# EAGLE design rotor_khamex_3.3 (EAGLE 7.6.0)

## Sheet 1 of 3
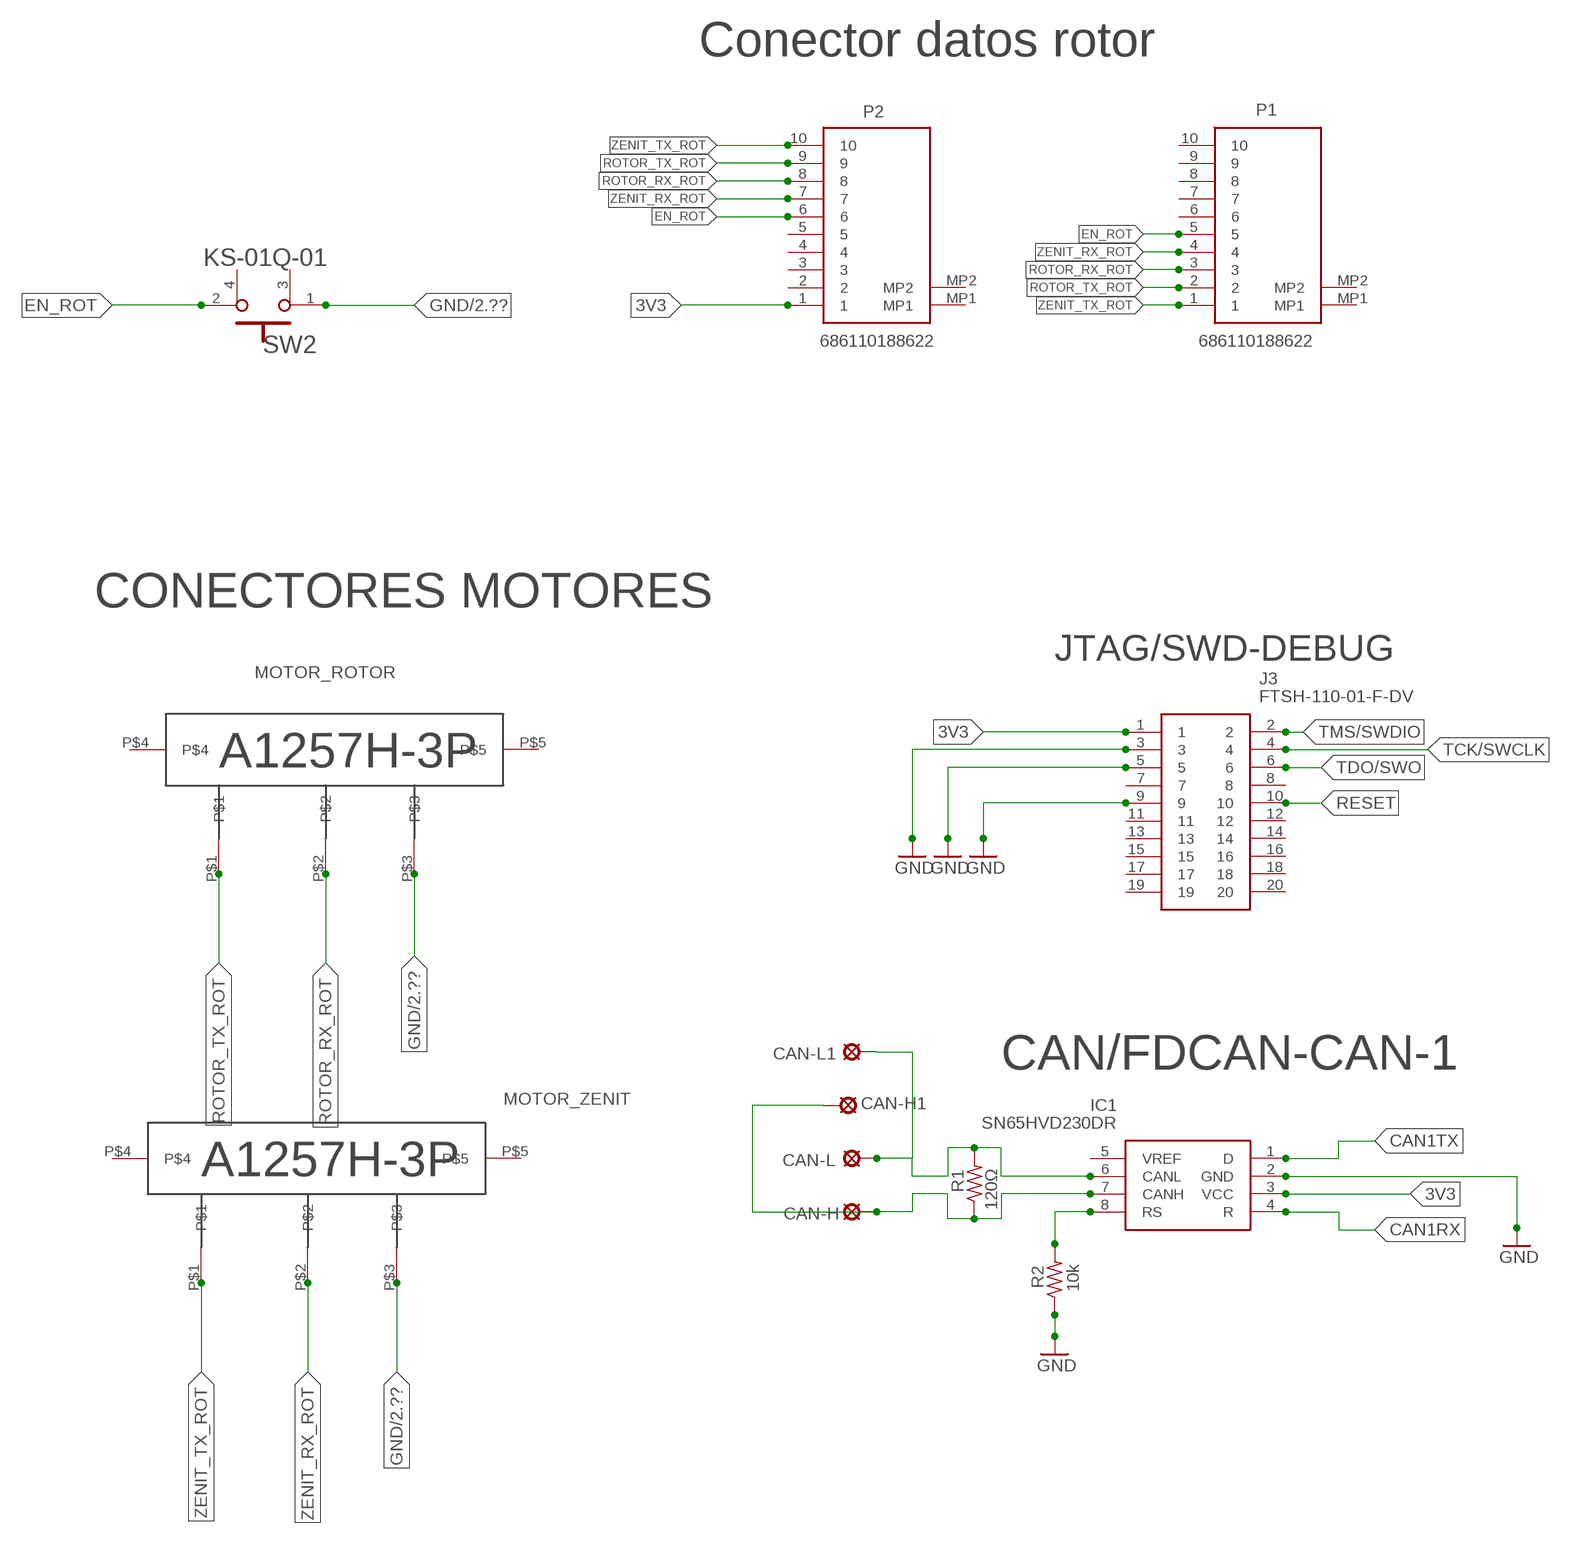
[diagram p0: schematic, sheet 1, part 1 of 2]
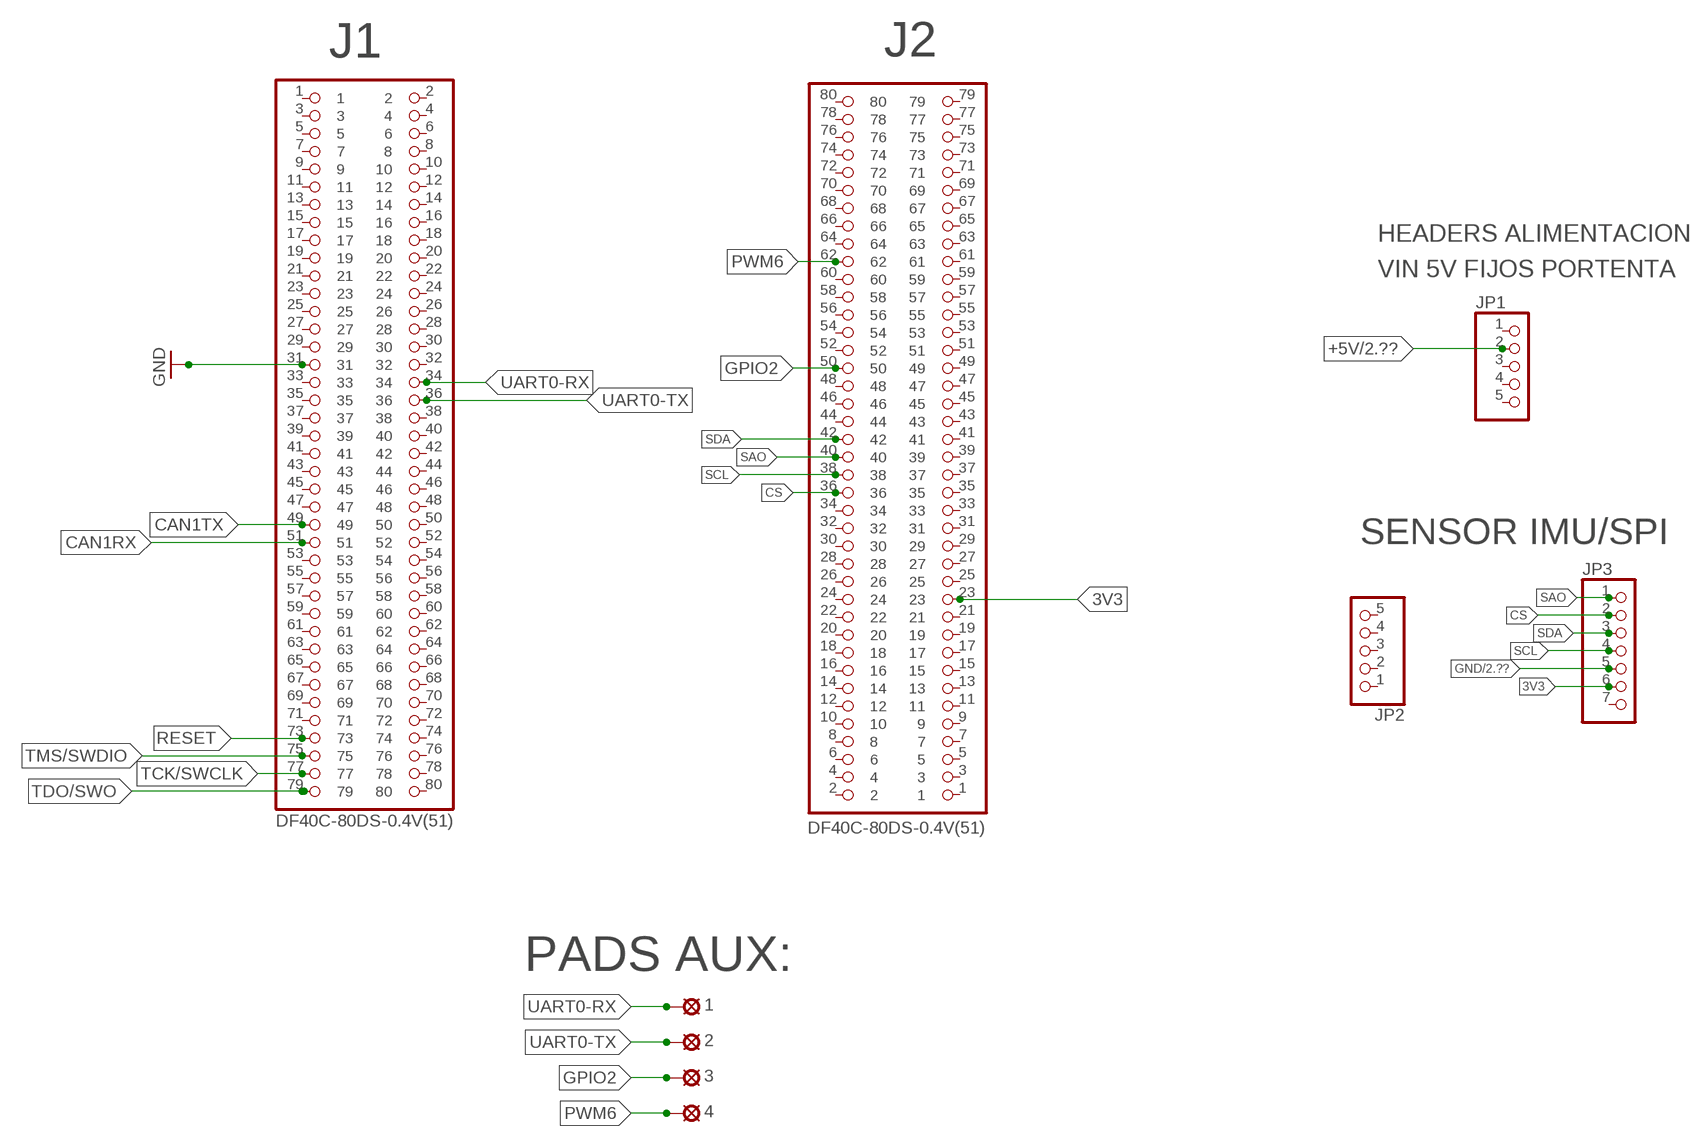
[diagram p1: schematic, sheet 1, part 2 of 2]

### Parts
1  LSP11  [LSP11]
2  LSP11  [LSP11]
3  LSP11  [LSP11]
4  LSP11  [LSP11]
CAN-H  LSP11  [LSP11]
CAN-H1  LSP11  [LSP11]
CAN-L  LSP11  [LSP11]
CAN-L1  LSP11  [LSP11]
IC1  SN65HVD230DR  [SOT127P600X175-8N]
J1  DF40C-80DS-0.4V(51)  [HRS_DF40C-80DS-0.4V(51)]
J2  DF40C-80DS-0.4V(51)  [HRS_DF40C-80DS-0.4V(51)]
J3  FTSH-110-01-F-DV  [FTSH-110-XX-YYY-DV]
JP1  PINHD-1X5  [1X05]
JP2  PINHD-1X5  [1X05]
JP3  PINHD-1X7  [1X07]
MOTOR_ROTOR  A1257H-3P_DEVICE  [A1257H-3P_PACK]
MOTOR_ZENIT  A1257H-3P_DEVICE  [A1257H-3P_PACK]
P1  686110188622  [686110188622]
P2  686110188622  [686110188622]
R1  120Ω  R-US_M0805  [M0805]
R2  10k  R-US_M0805  [M0805]
SW2  E-SWITCH_KS-01Q-01E-SWITCH_KS-01Q-01_0_0  [E-SWITCH_KS-01Q-01_0]

### Nets
3V3: IC1.3(VCC) J2.23 J3.1 JP3.6 P2.1
+5V [power]: JP1.2 ; also sheet 2
CAN1RX: IC1.4(R) J1.51
CAN1TX: IC1.1(D) J1.49
CS: J2.36 JP3.2
EN_ROT: P1.5 P2.6 SW2.2
GND: IC1.2(GND) J1.31 J3.3 J3.5 J3.9 JP3.5 MOTOR_ROTOR.P$3 MOTOR_ZENIT.P$3 R2.1 SW2.1 ; also sheet 2
GPIO2: 3.MP J2.50
N$12: CAN-H1.MP CAN-H.MP IC1.7(CANH) R1.1
N$13: CAN-L1.MP CAN-L.MP IC1.6(CANL) R1.2
N$15: IC1.8(RS) R2.2
PWM6: 4.MP J2.62
RESET: J1.73 J3.10
ROTOR_RX_ROT: MOTOR_ROTOR.P$2 P1.3 P2.8
ROTOR_TX_ROT: MOTOR_ROTOR.P$1 P1.2 P2.9
SAO: J2.40 JP3.1
SCL: J2.38 JP3.4
SDA: J2.42 JP3.3
TCK/SWCLK: J1.77 J3.4
TDO/SWO: J1.79 J3.6
TMS/SWDIO: J1.75 J3.2
UART0-RX: 1.MP J1.34
UART0-TX: 2.MP J1.36
ZENIT_RX_ROT: MOTOR_ZENIT.P$2 P1.4 P2.7
ZENIT_TX_ROT: MOTOR_ZENIT.P$1 P1.1 P2.10
Unconnected: IC1.5(VREF) J1.1 J1.2 J1.3 J1.4 J1.5 J1.6 J1.7 J1.8 J1.9 J1.10 J1.11 J1.12 J1.13 J1.14 J1.15 J1.16 J1.17 J1.18 J1.19 J1.20 J1.21 J1.22 J1.23 J1.24 J1.25 J1.26 J1.27 J1.28 J1.29 J1.30 J1.32 J1.33 J1.35 J1.37 J1.38 J1.39 J1.40 J1.41 J1.42 J1.43 J1.44 J1.45 J1.46 J1.47 J1.48 J1.50 J1.52 J1.53 J1.54 J1.55 J1.56 J1.57 J1.58 J1.59 J1.60 J1.61 J1.62 J1.63 J1.64 J1.65 J1.66 J1.67 J1.68 J1.69 J1.70 J1.71 J1.72 J1.74 J1.76 J1.78 J1.80 J2.1 J2.2 J2.3 J2.4 J2.5 J2.6 J2.7 J2.8 J2.9 J2.10 J2.11 J2.12 J2.13 J2.14 J2.15 J2.16 J2.17 J2.18 J2.19 J2.20 J2.21 J2.22 J2.24 J2.25 J2.26 J2.27 J2.28 J2.29 J2.30 J2.31 J2.32 J2.33 J2.34 J2.35 J2.37 J2.39 J2.41 J2.43 J2.44 J2.45 J2.46 J2.47 J2.48 J2.49 J2.51 J2.52 J2.53 J2.54 J2.55 J2.56 J2.57 J2.58 J2.59 J2.60 J2.61 J2.63 J2.64 J2.65 J2.66 J2.67 J2.68 J2.69 J2.70 J2.71 J2.72 J2.73 J2.74 J2.75 J2.76 J2.77 J2.78 J2.79 J2.80 J3.7 J3.8 J3.11 J3.12 J3.13 J3.14 J3.15 J3.16 J3.17 J3.18 J3.19 J3.20 JP1.1 JP1.3 JP1.4 JP1.5 JP2.1 JP2.2 JP2.3 JP2.4 JP2.5 JP3.7 MOTOR_ROTOR.P$4 MOTOR_ROTOR.P$5 MOTOR_ZENIT.P$4 MOTOR_ZENIT.P$5 P1.6 P1.7 P1.8 P1.9 P1.10 P1.MP1 P1.MP2 P2.2 P2.3 P2.4 P2.5 P2.MP1 P2.MP2 SW2.3 SW2.4

### Notes on the sheet
- Conector datos rotor
- HEADERS ALIMENTACION
- VIN 5V FIJOS PORTENTA
- SENSOR IMU/SPI
- CONECTORES MOTORES
- JTAG/SWD-DEBUG
- MOTOR_ROTOR
- PADS AUX:
- CAN/FDCAN-CAN-1
- MOTOR_ZENIT

## Sheet 2 of 3
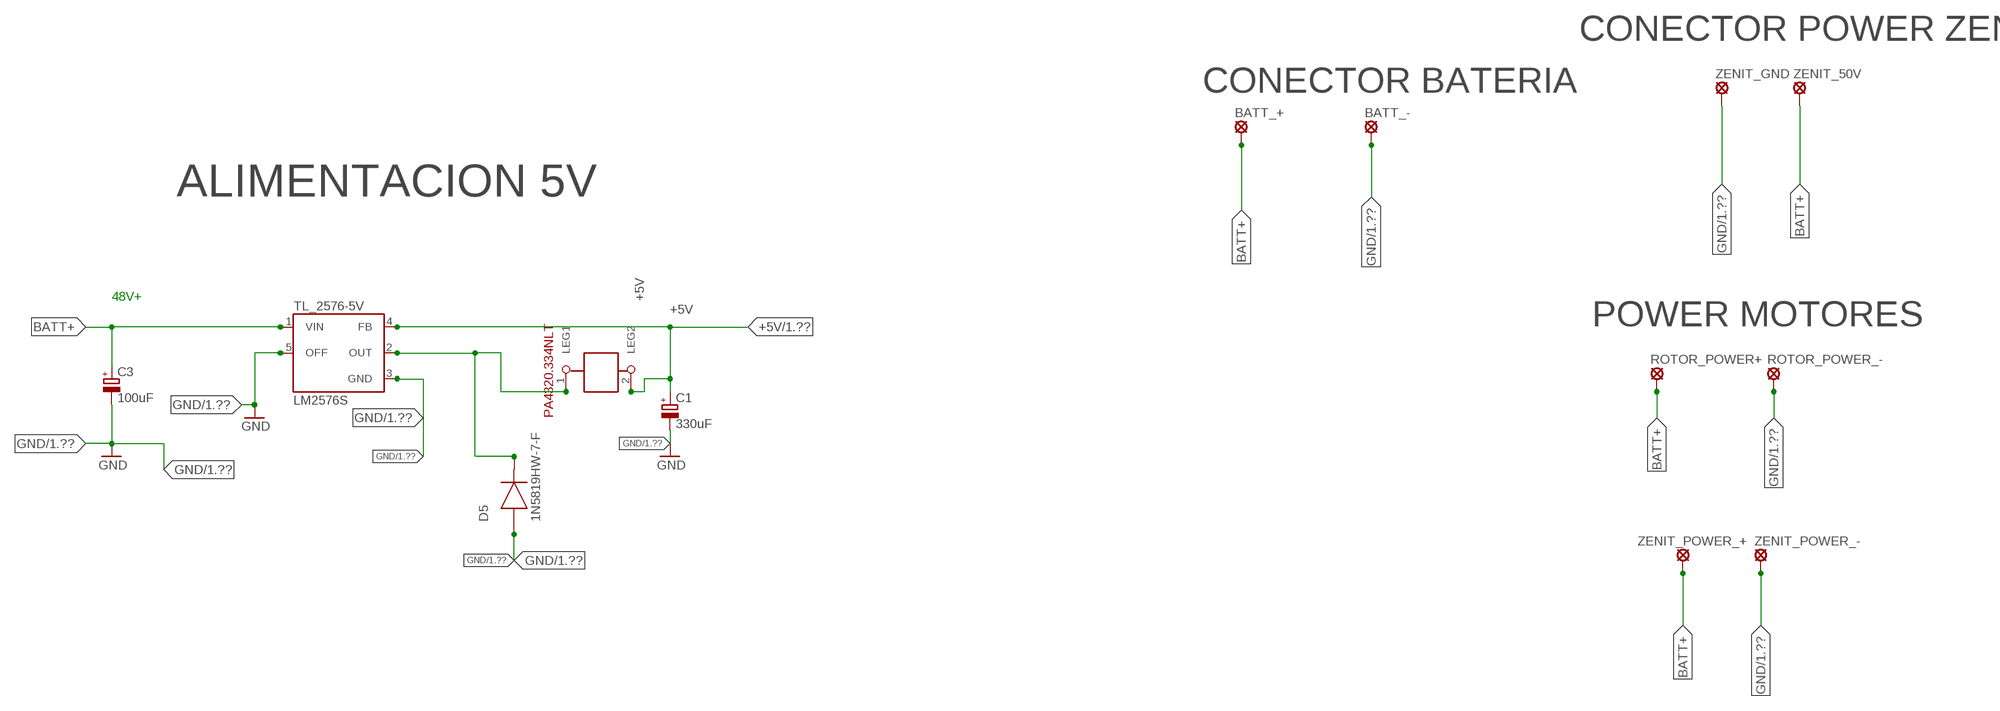
[diagram p2: schematic, sheet 2]

### Parts
BATT_+  SE14  [SE14]
BATT_-  SE14  [SE14]
C1  330uF  CPOL-EUE5-10.5  [E5-10,5]
C3  100uF  CPOL-EUE5-10.5  [E5-10,5]
D5  1N5819HW-7-F  [SOD370155X135]
L  1212  [1212SMDINDUCTORPACK]
ROTOR_POWER+  SE14  [SE14]
ROTOR_POWER_-  SE14  [SE14]
TL_2576-5V  LM2576S  [TO263-5]
ZENIT_50V  SE14  [SE14]
ZENIT_GND  SE14  [SE14]
ZENIT_POWER_+  SE14  [SE14]
ZENIT_POWER_-  SE14  [SE14]

### Nets
+5V [power]: C1.+ L.2(LEG2) TL_2576-5V.4(FB) ; also sheet 1
BATT+ [power]: BATT_+.MP C3.+ ROTOR_POWER+.MP TL_2576-5V.1(VIN) ZENIT_50V.MP ZENIT_POWER_+.MP
GND: BATT_-.MP C1.- C3.- D5.2(A) ROTOR_POWER_-.MP TL_2576-5V.3(GND) TL_2576-5V.5(OFF) ZENIT_GND.MP ZENIT_POWER_-.MP ; also sheet 1
N$2 [power]: D5.1(C) L.1(LEG1) TL_2576-5V.2(OUT)

### Notes on the sheet
- CONECTOR POWER ZENIT
- CONECTOR BATERIA
- ALIMENTACION 5V
- 48V+
- POWER MOTORES

## Sheet 3 of 3

## Library data of the parts
1-4 CAN-H CAN-H1 CAN-L CAN-L1 = solpad:LSP11: SOLDER PAD drill 1.1 mm
BATT_+ BATT_- ROTOR_POWER+ ROTOR_POWER_- ZENIT_50V ZENIT_GND ZENIT_POWER_+ ZENIT_POWER_- = solpad:SE14: SOLDER PAD E1553, drill 1,4mm, distributor Buerklin, 07F820
C1 C3 = rcl:CPOL-EU: POLARIZED CAPACITOR, European symbol
D5 = 1N5819HW-7-F:1N5819HW-7-F: 1N5819HW Series 40 V 1 A Surface Mount Schottky Barrier Rectifier - SOD-123; DESCRIPTION: 1N5819HW Series 40 V 1 A Surface Mount Schottky Barrier Rectifier - SOD-123; DIGI-KEY_PART_NUMBER: 1N5819HW-FDICT-ND; DIGI-KEY_PURCHASE_URL: https://www.digikey.es/product-detail/en/diodes-incorporated/1N5819HW-7-F/1N5819HW-FDICT-ND/815283?utm_source=snapeda&utm_medium=aggregator&utm_campaign=symbol; MF: Diodes Inc.; MP: 1N5819HW-7-F; PACKAGE: SOD-123 Diodes Inc.
IC1 = SN65HVD230DR:SN65HVD230DR: 3.3 V CAN Transceiver with Standby Mode Source: Datasheet <http://www.ti.com/lit/gpn/sn65hvd230>; DESCRIPTION: 3.3 V CAN Transceiver with Standby Mode; HEIGHT: 1.75mm; MANUFACTURER_NAME: Texas Instruments; MANUFACTURER_PART_NUMBER: SN65HVD230DR; MOUSER_PART_NUMBER: 595-SN65HVD230DR; MOUSER_PRICE-STOCK: https://www.mouser.co.uk/ProductDetail/Texas-Instruments/SN65HVD230DR?qs=QViXGNcIEAtifeQR3pYVUQ%3D%3D
J1 J2 = DF40C-80DS-0.4V_51_(1):DF40C-80DS-0.4V(51); CHECK_PRICES: https://www.snapeda.com/parts/DF40C-80DS-0.4V(51)/Hirose/view-part/?ref=eda; DESCRIPTION: Receptáculo del conector de la posición 80, contactos de la tira central Montaje en superficie Oro; DIGIKEY_PART_NUMBER: H11633CT-ND; MF: Hirose; MP: DF40C-80DS-0.4V(51); PACKAGE: None; SNAPEDA_LINK: https://www.snapeda.com/parts/DF40C-80DS-0.4V(51)/Hirose/view-part/?ref=snap
J3 = FTSH-110-01-F-DV:FTSH-110-01-F-DV: 20 Position, High Reliability Header Strips, 0.050" pitch Source: Datasheet <http://suddendocs.samtec.com/prints/ftsh-1xx-xx-xxx-dv-xxx-xxx-mkt.pdf>; DESCRIPTION: 20 Position, High Reliability Header Strips, 0.050&quot; pitch; HEIGHT: mm; MANUFACTURER_NAME: SAMTEC; MANUFACTURER_PART_NUMBER: FTSH-110-01-F-DV; MOUSER_PART_NUMBER: 200-FTSH11001FDV; MOUSER_PRICE-STOCK: https://www.mouser.co.uk/ProductDetail/Samtec/FTSH-110-01-F-DV?qs=92ilVni64gw1JaTDl9rCLg%3D%3D
JP1 JP2 = pinhead:PINHD-1X5: PIN HEADER
JP3 = pinhead:PINHD-1X7: PIN HEADER
L = smd 1212 inductor:1212
MOTOR_ROTOR MOTOR_ZENIT = A1257H-3P:A1257H-3P_DEVICE
P1 P2 = 686110188622:686110188622: FFC & FPC Connectors WR-FPC 1,0mm SMT Horiz. Top Contact Tin Plating{0000} Source: Datasheet <https://www.mouser.ch/datasheet/2/445/686110188622-1843591.pdf>; DESCRIPTION: FFC & FPC Connectors WR-FPC 1,0mm SMT Horiz. Top Contact Tin Plating{0000}; HEIGHT: 3.3mm; MANUFACTURER_NAME: Wurth Elektronik; MANUFACTURER_PART_NUMBER: 686110188622; MOUSER_PART_NUMBER: 710-686110188622; MOUSER_PRICE-STOCK: https://www.mouser.co.uk/ProductDetail/Wurth-Elektronik/686110188622?qs=OlC7AqGiEDnHUpT6yh27Lg%3D%3D
R1 R2 = rcl:R-US_: RESISTOR, American symbol
SW2 = E-Switch - KS-01Q-01:E-SWITCH_KS-01Q-01: Pushbutton Switch SPST-NO Standard Through Hole; ACTUATOR_TYPE: Round, Button; CAPACITANCE: 1.0pF; CURRENT_RATING: 10mA (DC); DATASHEET: https://upverter.com/datasheet/3b708556f29b55c7f5db677c77a74973be95ebea.pdf; DIGIKEY_DESCRIPTION: SWITCH Pushbutton Switch SPST-NO Standard Through Hole; DIGIKEY_PART_NUMBER: EG4791-ND; ELECTRICAL_LIFE: 250,000 Cycles; IMPORTED_FROM: octopart; LEAD_FREE: yes; MECHANICAL_LIFE: 500,000 Cycles; MF: E-Switch; MFG_PACKAGE_IDENT: 29-KS01Q01; MOUSER_PART_NUMBER: 612-KS-01Q-01; MPN: KS-01Q-01; NUM_PINS: 4; OCTOPART_PART_NUMBER: 72a6bab923faad61; PACKAGE: SW_PTH_12MM; PREFIX: SW; ROHS: yes; TEMPERATURE_RANGE_HIGH: +85°C; TEMPERATURE_RANGE_LOW: -20°C; VOLTAGE_RATING_-_DC: 35V; VOLTAGE_RATING_AC: 35 V
TL_2576-5V = v-reg-3:LM2576: National Semiconductor <http://www.national.com> 3.0A "Simple Switcher"(c) 52kHz, Vout 1.23-37V (HV: 57V), Vin 40V (HV: 60V), 50µA standby current

## Net classes
0 default: width 0.381 mm, drill 0.01 mm, clearance 0.254 mm
1 power: width 1.27 mm, drill 0.762 mm, clearance 0.254 mm
2 thin: width 0.254 mm, drill 0.254 mm, clearance 0.254 mm

## Board
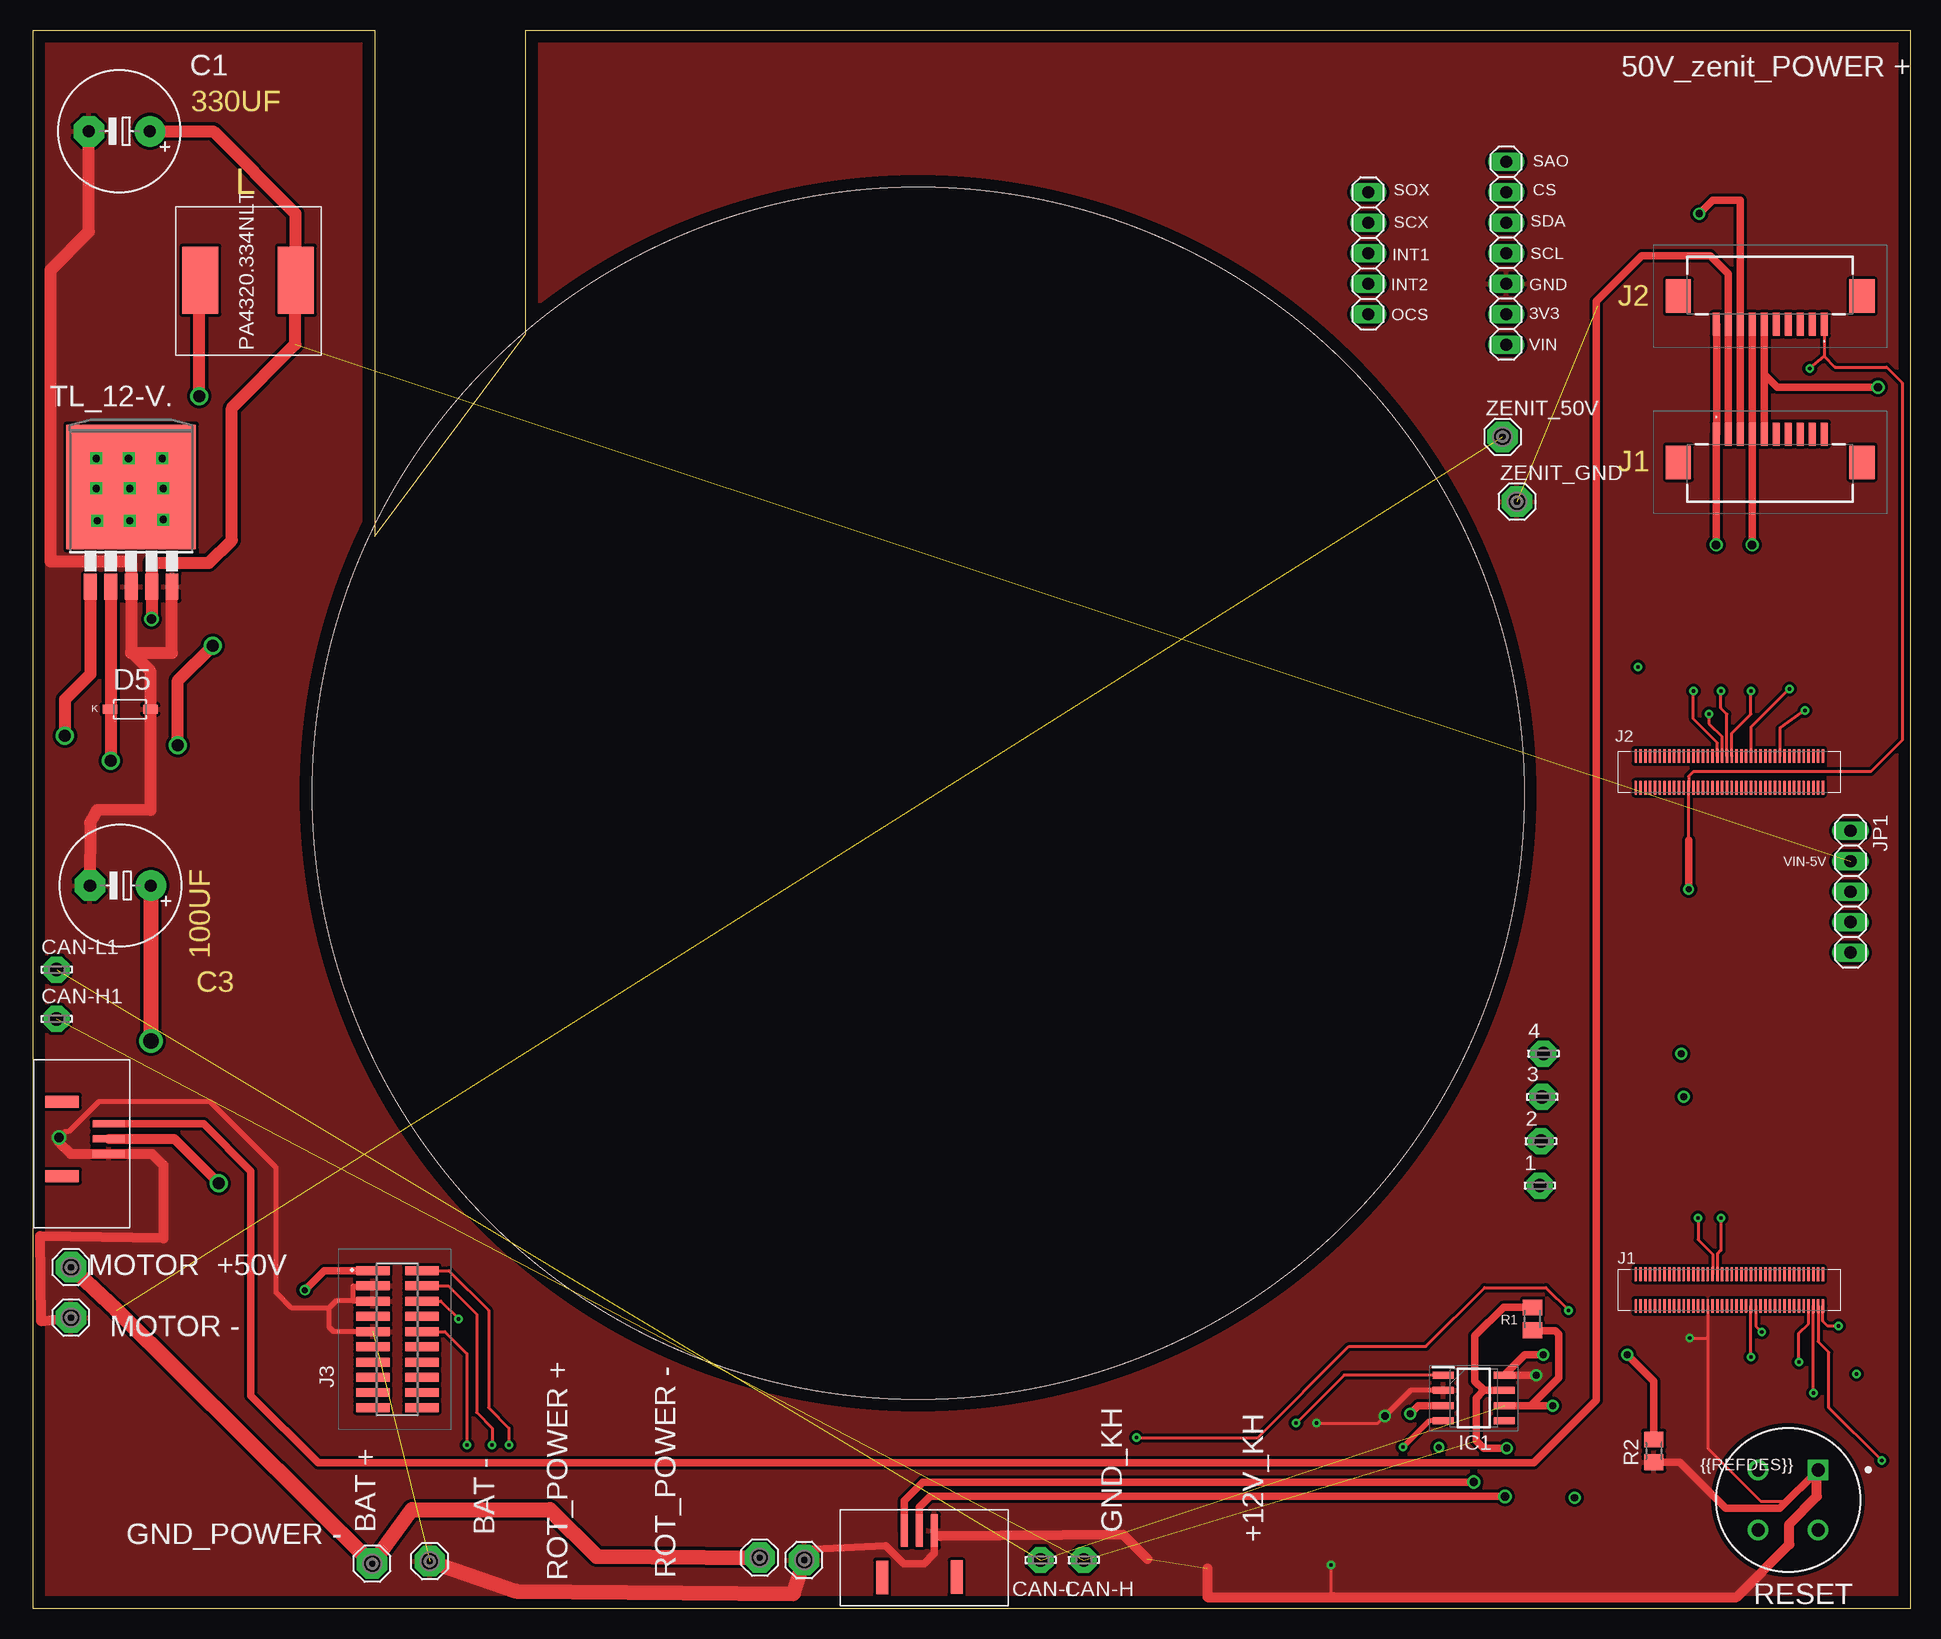
[diagram p3: board, top side]
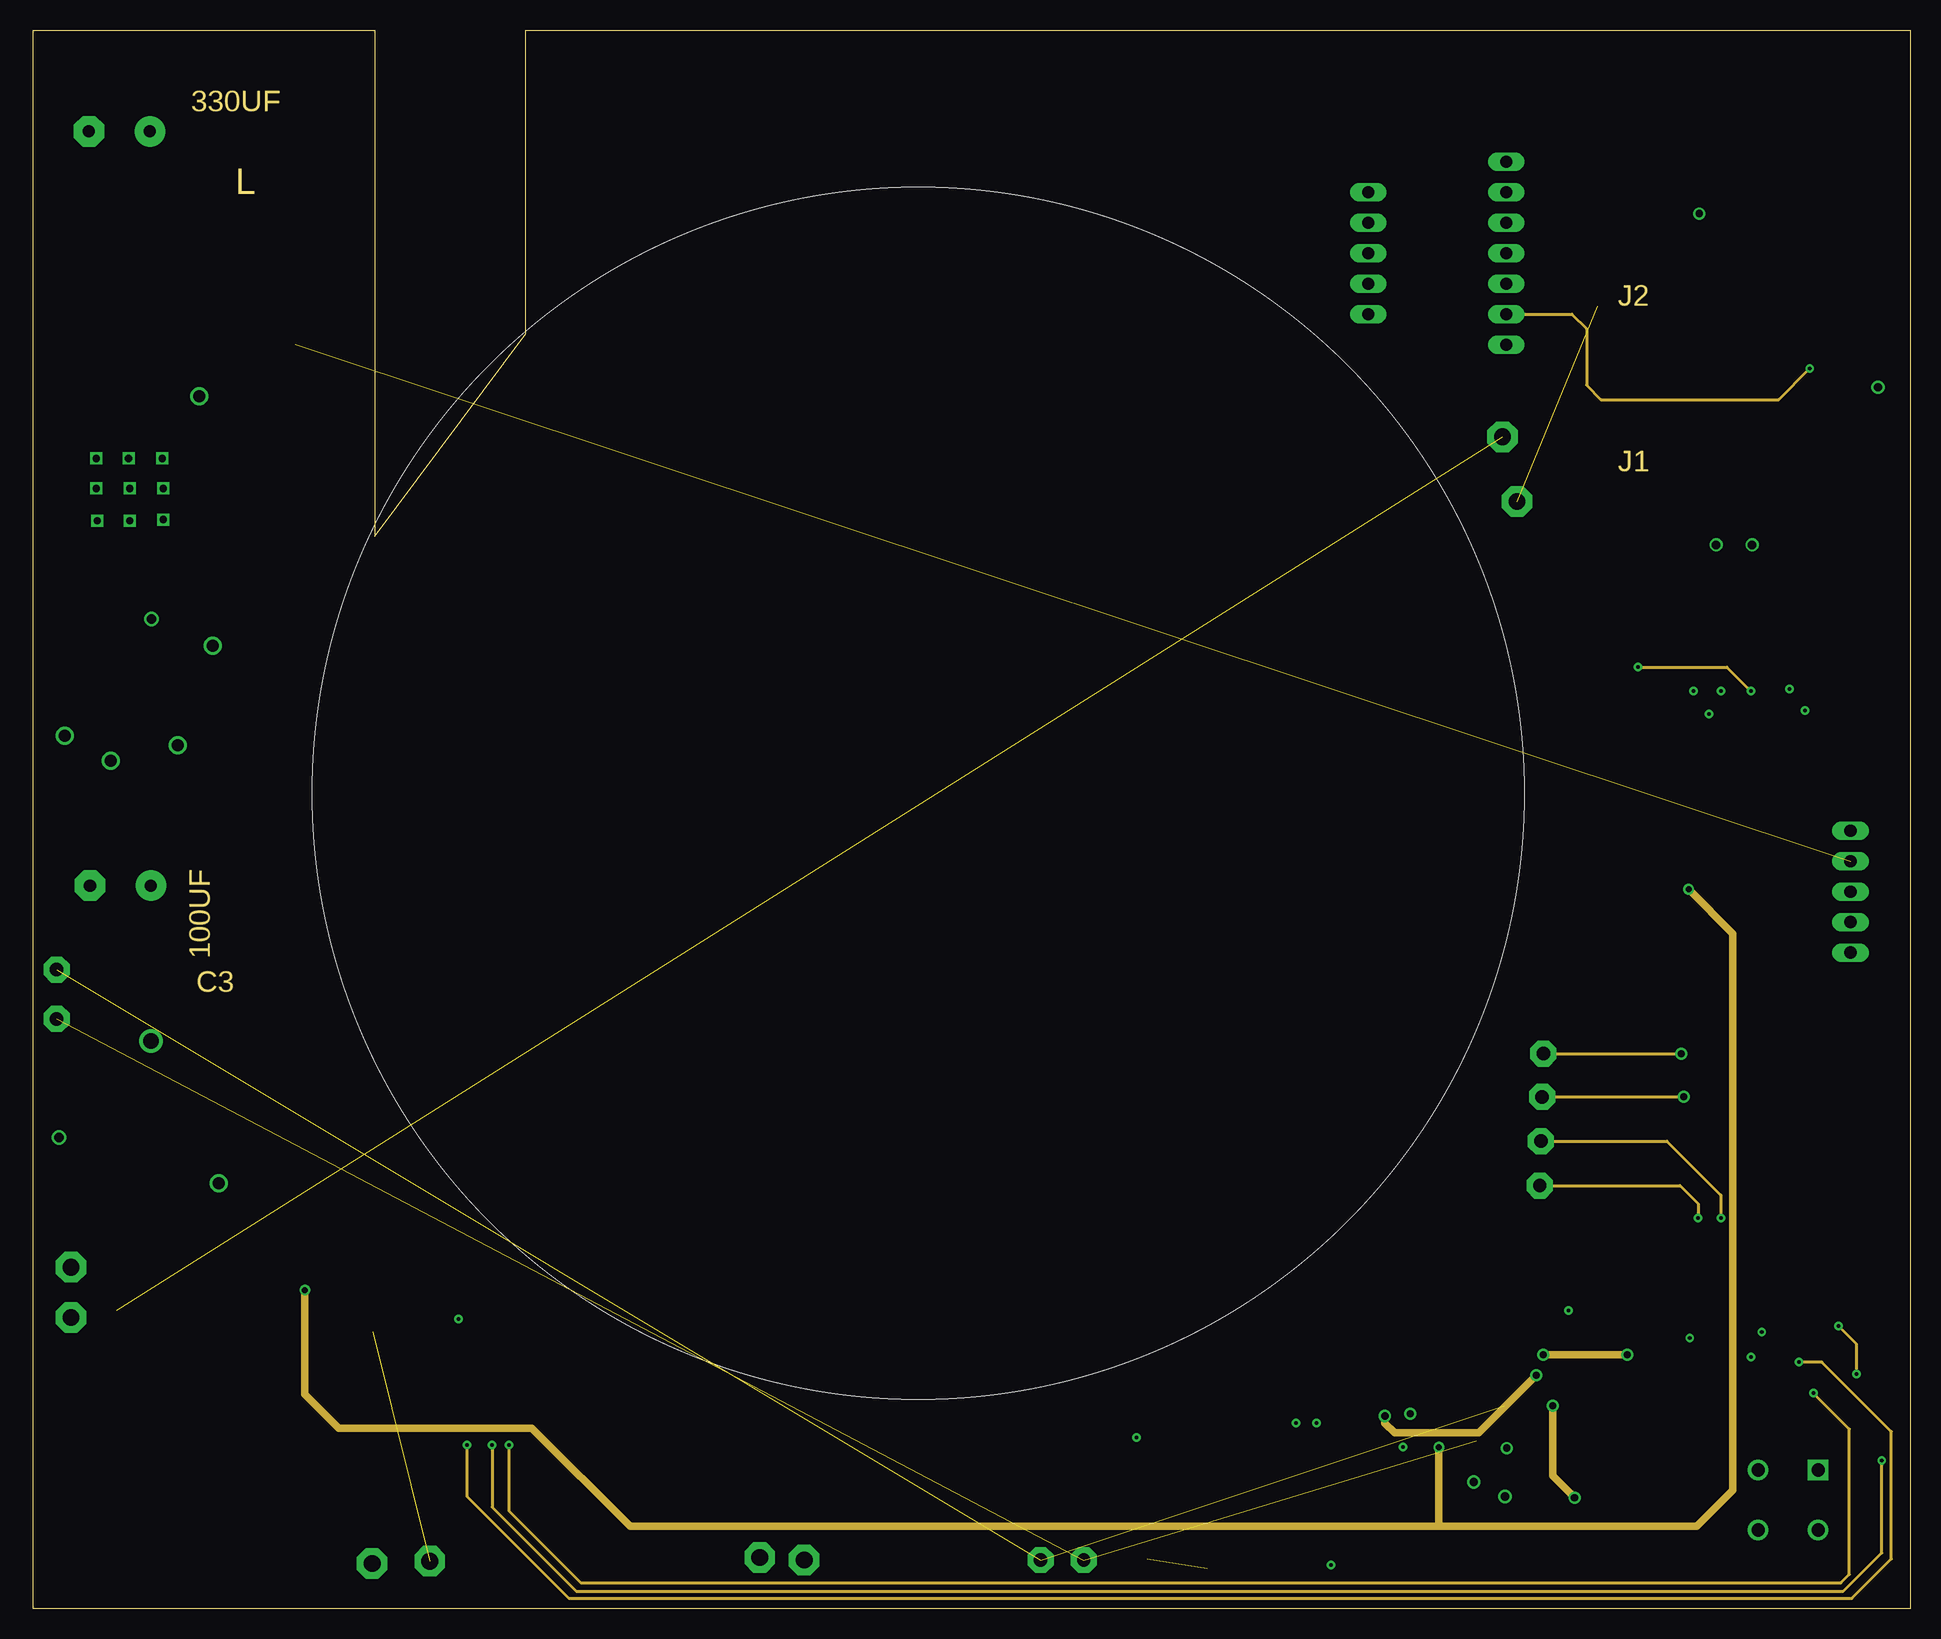
[diagram p4: board, inner layer Route2]
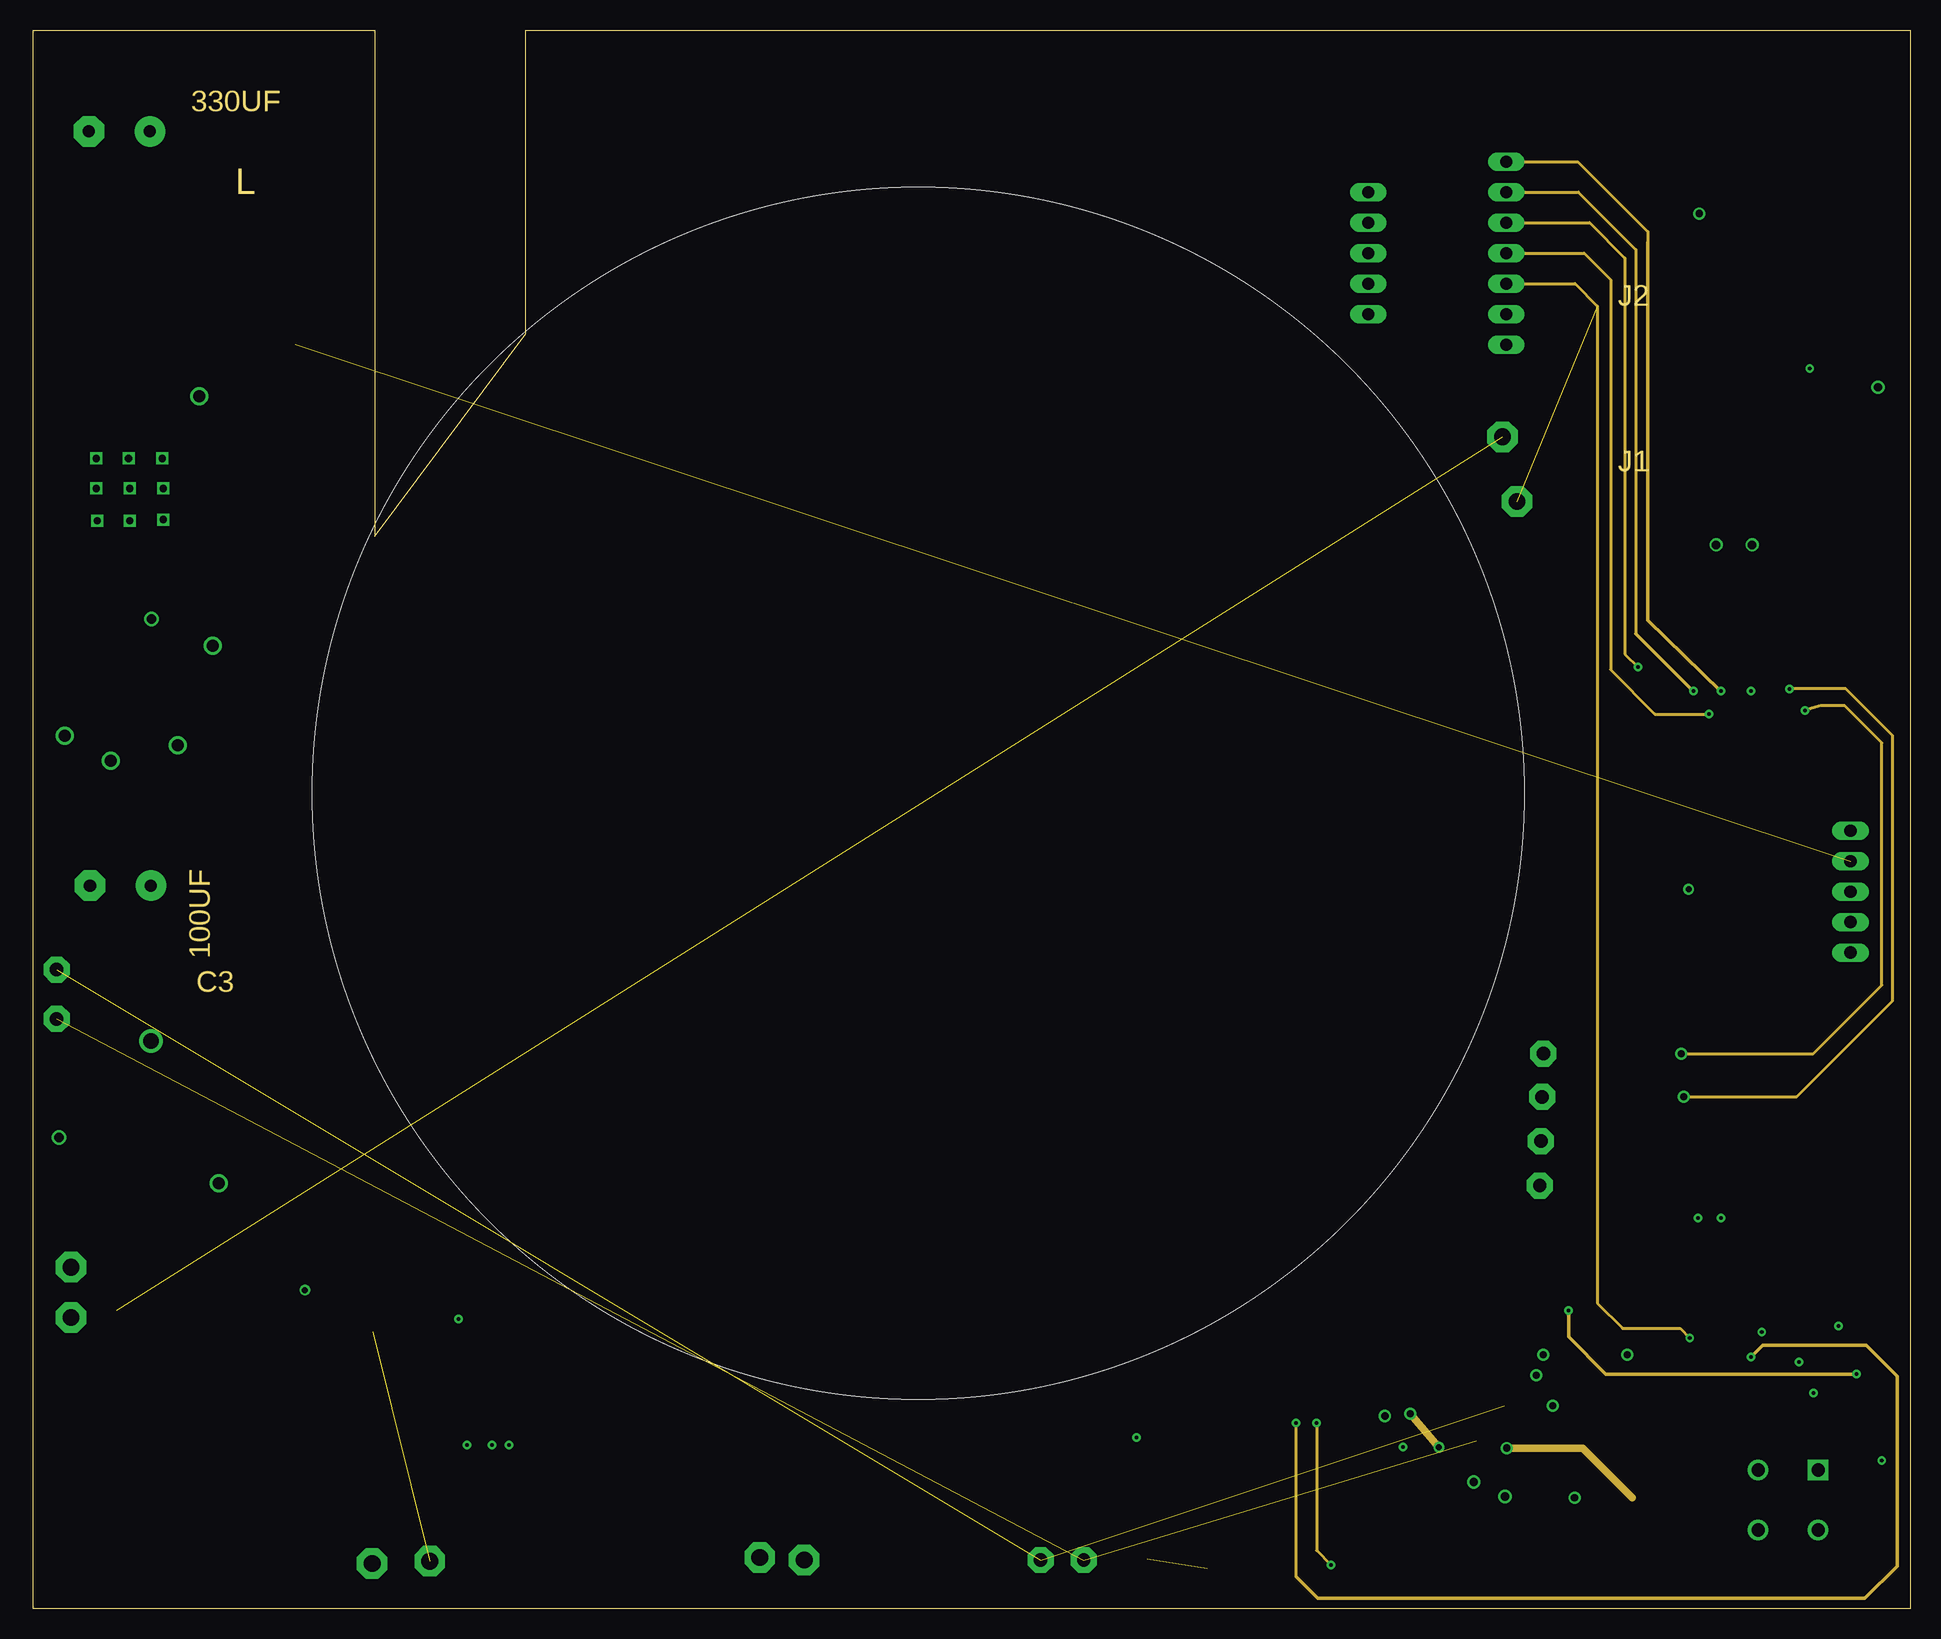
[diagram p5: board, inner layer Route15]
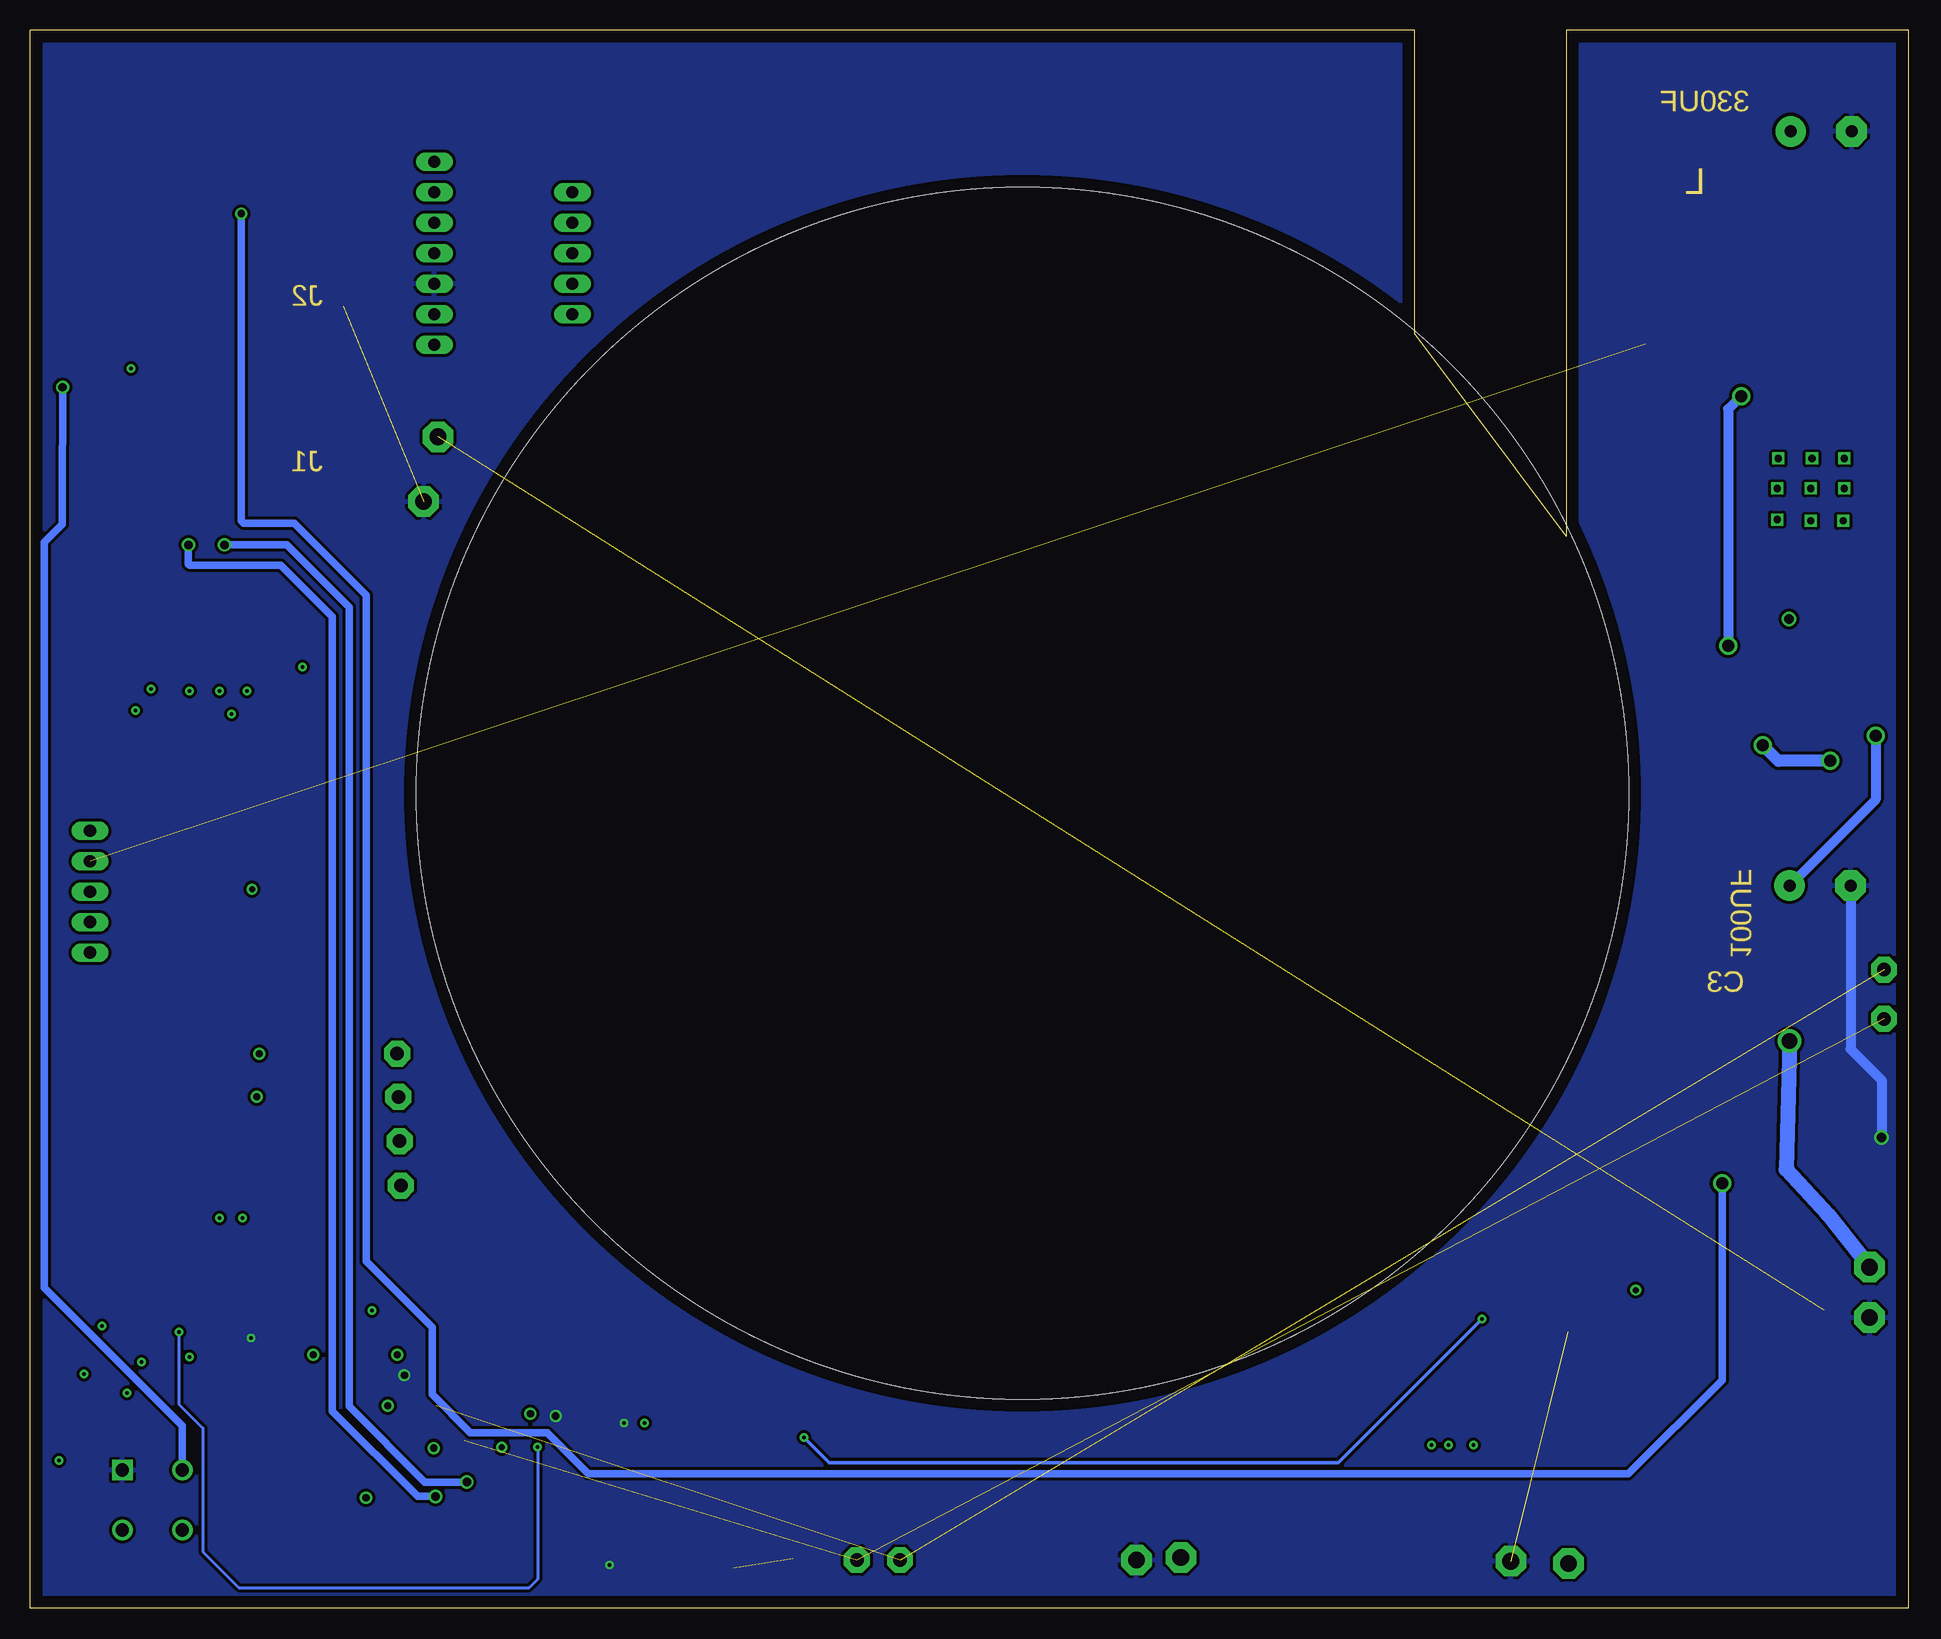
[diagram p6: board, bottom side, seen from below]

Size 156.5 x 131.5 mm. Coordinates in mm from the lower left corner, seen from the top.
Outline: 0,0 156.5,0 156.5,131.5 41.1,131.5 41.1,106.2 28.5,89.3 28.5,131.5 0,131.5 0,0
Copper layers (1*2*15*16): Top 0.035mm / dielectric 1.5mm / Route2 0.035mm / dielectric 0.15mm / Route15 0.035mm / dielectric 0.2mm / Bottom 0.035mm
Design rules "default *": minimum track width 10mil, minimum drill 24mil, track to track 8mil, track to pad 8mil, pad to pad 8mil, via to via 8mil, smd to smd 8mil, copper to edge 40mil, drill to drill 8mil, minimum pad ring 10mil, minimum via ring 8mil, stop-mask expansion 4mil, vias tented up to drill 0mil, thermal gap 10mil
Holes 101 mm at 73.8,67.9
Holes 3.2 mm at 191.8,89 191.6,78.2 191.6,72.1 191.7,83.6

### Footprints (pad centres in the part's own frame; a part is rotated, then mirrored left to right if it is on the bottom)
LSP11 = drill 1.118 pad 2.159 octagon: MP 0,0
SE14 = drill 1.397 pad 2.54 octagon: MP 0,0
E5-10,5 = drill 1.016 pad 2.54: + -2.54,0 | drill 1.016 pad 2.54 octagon: - 2.54,0
SOD370155X135 = smd 1.21 x 0.73: 1 -1.68,0; 2 1.68,0
SOT127P600X175-8N = smd 1.75 x 0.6: 1 -2.55,1.905; 2 -2.55,0.635; 3 -2.55,-0.635; 4 -2.55,-1.905; 5 2.55,-1.905; 6 2.55,-0.635; 7 2.55,0.635; 8 2.55,1.905
HRS_DF40C-80DS-0.4V(51) = smd 0.2 x 1.14: 1 -7.8,-1.32; 2 -7.8,1.32; 3 -7.4,-1.32; 4 -7.4,1.32; 5 -7,-1.32; 6 -7,1.32; 7 -6.6,-1.32; 8 -6.6,1.32; 9 -6.2,-1.32; 10 -6.2,1.32; 11 -5.8,-1.32; 12 -5.8,1.32; 13 -5.4,-1.32; 14 -5.4,1.32; 15 -5,-1.32; 16 -5,1.32; 17 -4.6,-1.32; 18 -4.6,1.32; 19 -4.2,-1.32; 20 -4.2,1.32; 21 -3.8,-1.32; 22 -3.8,1.32; 23 -3.4,-1.32; 24 -3.4,1.32; 25 -3,-1.32; 26 -3,1.32; 27 -2.6,-1.32; 28 -2.6,1.32; 29 -2.2,-1.32; 30 -2.2,1.32; 31 -1.8,-1.32; 32 -1.8,1.32; 33 -1.4,-1.32; 34 -1.4,1.32; 35 -1,-1.32; 36 -1,1.32; 37 -0.6,-1.32; 38 -0.6,1.32; 39 -0.2,-1.32; 40 -0.2,1.32; 41 0.2,-1.32; 42 0.2,1.32; 43 0.6,-1.32; 44 0.6,1.32; 45 1,-1.32; 46 1,1.32; 47 1.4,-1.32; 48 1.4,1.32; 49 1.8,-1.32; 50 1.8,1.32; 51 2.2,-1.32; 52 2.2,1.32; 53 2.6,-1.32; 54 2.6,1.32; 55 3,-1.32; 56 3,1.32; 57 3.4,-1.32; 58 3.4,1.32; 59 3.8,-1.32; 60 3.8,1.32; 61 4.2,-1.32; 62 4.2,1.32; 63 4.6,-1.32; 64 4.6,1.32; 65 5,-1.32; 66 5,1.32; 67 5.4,-1.32; 68 5.4,1.32; 69 5.8,-1.32; 70 5.8,1.32; 71 6.2,-1.32; 72 6.2,1.32; 73 6.6,-1.32; 74 6.6,1.32; 75 7,-1.32; 76 7,1.32; 77 7.4,-1.32; 78 7.4,1.32; 79 7.8,-1.32; 80 7.8,1.32
FTSH-110-XX-YYY-DV = smd 0.74 x 2.79: 1 -5.715,-2.035; 2 -5.715,2.035; 3 -4.445,-2.035; 4 -4.445,2.035; 5 -3.175,-2.035; 6 -3.175,2.035; 7 -1.905,-2.035; 8 -1.905,2.035; 9 -0.635,-2.035; 10 -0.635,2.035; 11 0.635,-2.035; 12 0.635,2.035; 13 1.905,-2.035; 14 1.905,2.035; 15 3.175,-2.035; 16 3.175,2.035; 17 4.445,-2.035; 18 4.445,2.035; 19 5.715,-2.035; 20 5.715,2.035
1X05 = drill 1.016 long: 1 -5.08,0; 2 -2.54,0; 3 0,0; 4 2.54,0; 5 5.08,0
1X07 = drill 1.016 long: 1 -7.62,0; 2 -5.08,0; 3 -2.54,0; 4 0,0; 5 2.54,0; 6 5.08,0; 7 7.62,0
1212SMDINDUCTORPACK = smd 5.6 x 3: 1 -0.1,3.91; 2 -0.1,-4.045
A1257H-3P_PACK = smd 0.6 x 2.7: P$1 2.35,5.25; P$2 3.6,5.25; P$3 4.85,5.25 | smd 1 x 2.8: P$4 0.5,1.35; P$5 6.7,1.37
686110188622 = smd 0.6 x 1.9: 1 -4.5,2.825; 2 -3.5,2.825; 3 -2.5,2.825; 4 -1.5,2.825; 5 -0.5,2.825; 6 0.5,2.825; 7 1.5,2.825; 8 2.5,2.825; 9 3.5,2.825; 10 4.5,2.825 | smd 2.1 x 2.8: MP1 -7.65,0.475; MP2 7.65,0.475
M0805 = smd 1.3 x 1.6: 1 -0.95,0; 2 0.95,0
E-SWITCH_KS-01Q-01_0 = drill 1.1 pad 1.7 square: 1 2.5,2.5 | drill 1.1 pad 1.7: 2 -2.5,2.5; 3 2.5,-2.5; 4 -2.5,-2.5
TO263-5 = smd 1.067 x 2.159: 1 -3.404,-5.791; 2 -1.702,-5.791; 3 0,-5.791; 4 1.702,-5.791; 5 3.404,-5.791 | smd 10.8 x 10.41: 6 0,2.54

### Placement (x,y rotation side)
1  125.6,35.2 0 top
2  125.7,38.9 0 top
3  125.8,42.6 0 top
4  125.9,46.2 0 top
BATT_+  28.3,3.7 180 top
BATT_-  33.1,3.9 180 top
C1  7.23,123.06 180 top
C3  7.32,60.2 180 top
CAN-H  87.6,4 0 top
CAN-H1  2,49.1 0 top
CAN-L  84,4 0 top
CAN-L1  2,53.2 0 top
D5  8.13,74.9 0 top
IC1  120.1,17.5 0 top
J1  141.4,26.49 0 top
J2  141.4,69.68 0 top
J3  30.4,22.4 270 top
JP1  151.5,59.7 270 top
JP2  111.3,112.9 90 top
JP3  122.8,112.9 270 top
L  17.89,110.74 90 top
MOTOR_ROTOR  1.1,42.7 270 top
MOTOR_ZENIT  70.3,1.2 0 top
P1  144.8,95 0 top
P2  144.8,109.8 180 top
R1  125,24.1 270 top
R2  135.1,13.1 90 top
ROTOR_POWER+  60.6,4.2 180 top
ROTOR_POWER_-  64.3,4 180 top
SW2  146.3,9 0 top
TL_2576-5V  8.22,90.88 0 top
ZENIT_50V  122.5,97.6 0 top
ZENIT_GND  123.7,92.2 0 top
ZENIT_POWER_+  3.2,28.4 180 top
ZENIT_POWER_-  3.2,24.2 180 top

### Tracks (layer width: path | path; a pad name or v marks a point on that pad's centre or on a via)
3V3  (via drill 0.3 pad 0.25, 0.5, 0.6)
  Top 0.254: P2.1 149.3,104.3 | 149.3,104.3 150.2,103.4 154.5,103.4 155.8,102.1 155.8,72.3 153.2,69.7 138.4,69.7 138,69.3 J2.23 138,64 | v148.1,103.3 149.3,104.3
  Top 0.61: IC1.3 115.47,16.86 v114.8,16.2 | J3.1 24.32,28.11 v22.7,26.5 | 138,64 v138,59.9
  Route2 0.254: 117.2,6.81 117.19,6.8 | JP3.6 128.28,107.82 129.5,106.6 129.5,101.9 130.7,100.7 145.5,100.7 v148.1,103.3
  Route2 0.61: v22.7,26.5 22.7,17.8 25.5,15 41.6,15 49.8,6.8 117.19,6.8 138.7,6.8 141.7,9.8 141.7,56.2 v138,59.9 | v117.2,13.4 117.2,6.81
  Route15 0.61: v114.8,16.2 v117.2,13.4
+5V  (via drill 0.8)  (1 unrouted)
  Top 1.016: TL_2576-5V.4 9.92,87.1 14.7,87.1 16.6,89 16.6,100 21.9,105.3 21.9,110 21.8,110.1 21.8,110.5 L.2 21.9,110.67 21.9,116.2 15.04,123.06 C1.+ | TL_2576-5V.4 | TL_2576-5V.4 9.92,82.4 v9.9,82.4
BATT+  (via drill 1, 1.3)  (1 unrouted)
  Top 1.016: TL_2576-5V.1 4.82,77.82 2.7,75.7 v2.7,72.7
  Top 1.27: ROTOR_POWER+.MP 47,4.3 43.1,8.2 31.6,8.2 BATT_+.MP 7,24.8 ZENIT_POWER_+.MP | C3.+ v9.86,47.25
  Bottom 0.813: v2.7,72.7 2.7,67.36 C3.+
  Bottom 1.27: v9.86,47.25 10.16,36.56 6.7,32.8 ZENIT_POWER_+.MP
CAN1RX  (via drill 0.3)
  Top 0.254: J1.51 143.6,23.5 v144.1,23
  Top 0.406: IC1.4 117.5,15.6 | 117.5,15.6 116.4,15.6 v114.2,13.4 | IC1.4 117.5,15.6
  Bottom 0.254: v144.1,23 144.1,17 142.1,15 142.1,4.7 139.1,1.7 114.9,1.7 114.2,2.4 v114.2,13.4
CAN1TX  (via drill 0.3)
  Top 0.254: IC1.1 109.31,19.41 v105.3,15.4 | v143.2,20.9 J1.49
  Route15 0.254: 105.3,2.6 v105.3,15.4
  Route15 0.305: 105.3,2.6 107.1,0.8 152.7,0.8 155.4,3.5 155.4,19.3 152.8,21.9 144.2,21.9 v143.2,20.9
CS  (via drill 0.3 pad 0.25)
  Top 0.254: J2.36 140.4,72.1 138.4,74.1 v138.4,76.4
  Route15 0.254: JP3.2 128.82,117.98 133.6,113.2 133.6,81.2
  Route15 0.305: 133.6,81.2 v138.4,76.4
EN_ROT  (via drill 0.7)
  Top 0.61: v153.78,101.73 145.37,101.73 144.3,102.8 | 144.3,102.8 P2.6 | P1.5 144.3,102.8
  Bottom 0.61: SW2.2 143.8,15.2 155.3,26.7 155.3,88.8 153.8,90.3 153.8,92.11 v153.78,101.73
GND  (via drill 0.3, 0.3 pad 0.25, 0.6, 0.8)  (3 unrouted)
  Top 0.254: J1.31 139.6,22.6 | 139.6,22.6 139.6,13.3 144,8.9 146.2,8.9 SW2.1 | v108.2,3.6 108.2,1.1 108.4,0.9 | v107,15.4 112.1,15.4 v112.7,16 | 28.34,25.6 J3.5 | v138.1,22.5 139.5,22.5 139.6,22.6
  Top 0.406: 75.6,6 MOTOR_ZENIT.P$3 | 148.7,11.4 SW2.1 | IC1.2 114.83,18.14 v112.7,16 | J3.5 26.71,25.57 26.71,25.58 26.71,26.82 26.72,26.83 J3.3 | 28.34,25.6 25.3,25.6 24.7,25 | 24.7,25 24.7,23.43 25.1,23.04 J3.9 | 24.7,25 21.6,25 20.3,26.3 20.3,36.7 14.8,42.2 5.5,42.2 3,39.7 2.7,39.7 v2.2,39.2
  Top 0.61: MOTOR_ZENIT.P$3 75.15,4.55 74.3,3.7 72.6,3.7 71.1,5.2 65,4.9 ROTOR_POWER_-.MP | 6.3,37.8 MOTOR_ROTOR.P$3 | R2.1 137.25,12.15 141.1,8.3 145.6,8.3 SW2.1 | v125.3,19.4 122.66,19.4
  Top 0.813: 75.6,6 90.9,6.1 92.9,4.1 | ZENIT_POWER_-.MP 0.7,23.9 0.6,31 10.9,30.8 10.9,36.9 9.95,37.85 MOTOR_ROTOR.P$3 3.17,37.85 2.2,38.82 v2.2,39.2 | 148.7,11.4 148.7,9.3 146.4,7 146.4,5.3 142,0.9 108.4,0.9 97.9,0.9 97.9,3.3
  Top 1.016: TL_2576-5V.3 8.22,87.08 8.2,87.1 8.2,87.2 1.5,87.2 1.5,111.5 4.7,114.7 C1.- | TL_2576-5V.3 8.22,79.68 9.8,78.1 D5.2 9.81,66.51 5.4,66.5 4.8,65.42 C3.- | TL_2576-5V.3 8.22,79.6 11.6,79.6 11.6,85.09 TL_2576-5V.5
  Top 1.27: BATT_-.MP 40.3,1.4 63.4,1.2 ROTOR_POWER_-.MP
  Route2 0.61: v112.7,16 112.7,15.4 113.5,14.6 120.5,14.6 v125.3,19.4
  Route15 0.254: v107,15.4 107,4.8 v108.2,3.6 | JP3.5 128.54,110.36 130.4,108.5 130.4,25.4 132.5,23.3 137.3,23.3 v138.1,22.5
  Bottom 0.813: C3.- 4.78,46.58 2.2,44 v2.2,39.2
  pour Top: -6.4,139.1 169.8,139.1 169.8,-9.4 -6.4,-9.4
  pour Bottom: -3.3,135.4 162.5,135.4 162.5,-4.9 -3.3,-4.9
GPIO2  (via drill 0.3, 0.6)
  Top 0.254: v146.4,76.6 143.2,73.4 J2.50
  Route2 0.254: 3.MP v137.6,42.6
  Route15 0.254: v137.6,42.6 147,42.6 155,50.6 155,72.7 151.1,76.6 v146.4,76.6
N$1  (via drill 0.6)
  other vias: 5.3,95.8
N$2  (via drill 1)
  Top 1.016: D5.1 6.52,74.97 TL_2576-5V.2 6.52,70.6 v6.5,70.6 | v12.1,71.9 12.1,77.3 v15,80.2 | 13.72,110.9 L.1 13.9,110.64 v13.9,101
  Bottom 0.813: v13.9,101 15,99.9 v15,80.2
  Bottom 1.016: v6.5,70.6 10.8,70.6 v12.1,71.9
N$3  (via drill 0.6)
  other vias: 8,95.8
N$4  (via drill 0.6)
  other vias: 10.8,95.8
N$5  (via drill 0.6)
  other vias: 5.3,93.3
N$6  (via drill 0.6)
  other vias: 8.1,93.3
N$7  (via drill 0.6)
  other vias: 10.9,93.3
N$8  (via drill 0.6)
  other vias: 10.9,90.7
N$9  (via drill 0.6)
  other vias: 8.1,90.6
N$10  (via drill 0.6)
  other vias: 5.4,90.6
N$12  (via drill 0.6)  (2 unrouted)
  Top 0.61: R1.1 122.58,25.05 120.2,22.67 120.2,18.9 120.97,18.14 IC1.7 120.94,18.14 120.3,17.5 120.3,13.94 120.93,13.31 122.84,13.31 v122.86,13.33
  Route15 0.61: v122.86,13.33 129.17,13.33 133.3,9.2
N$13  (via drill 0.6)  (2 unrouted)
  Top 0.61: v126.68,16.86 v126.67,16.86 IC1.6 124.86,16.86 127.2,19.2 127.2,22.8 126.9,23.1 125.05,23.1 R1.2
  Route2 0.61: v126.68,16.86 126.68,11.02 v128.5,9.2
N$15  (via drill 0.6)
  Top 0.61: R2.2 135.1,18.9 v132.9,21.1 | v125.9,21.1 124.34,21.1 IC1.8
  Route2 0.61: v132.9,21.1 v125.9,21.1
PWM6  (via drill 0.3, 0.6)
  Top 0.254: J2.62 145.6,73.3 147.4,74.6 v147.7,74.8
  Route2 0.254: 4.MP v137.4,46.2
  Route15 0.254: v137.4,46.2 148.4,46.2 154.1,51.9 154.1,72.1 151,75.2 149,75.2 v147.7,74.8
RESET  (via drill 0.3)
  Top 0.254: J3.10 34.37,23.04 36.2,21.2 v36.2,13.6 | v147.2,20.5 147.2,22.9 148,23.7 J1.73
  Route2 0.254: v36.2,13.6 36.2,9.3 44.7,0.8 151.6,0.8 154.9,4.1 154.9,14.7 149.1,20.5 v147.2,20.5
ROTOR_RX_ROT  (via drill 0.6, 1)
  Top 0.381: 6.35,39.16 MOTOR_ROTOR.P$2
  Top 0.61: P1.3 P2.8 142.3,117.3 140,117.3 v138.9,116.2
  Top 0.813: MOTOR_ROTOR.P$2 11.8,39.1 v15.5,35.4
  Bottom 0.61: v15.5,35.4 15.5,19 23.3,11.2 110,11.2 113.4,14.6 119.8,14.6 123,17.8 123,23.4 128.5,28.9 128.5,84.4 134.5,90.4 138.7,90.4 138.9,90.6 v138.9,116.2
ROTOR_TX_ROT
  Top 0.61: P1.2 P2.9 141.3,111.2 139.8,112.7 134.1,112.7 130.3,108.9 130.3,17.3 125.1,12.1 23.8,12.1 18.2,17.7 18.2,36.4 14.25,40.35 MOTOR_ROTOR.P$1
SAO  (via drill 0.3 pad 0.25)
  Top 0.254: J2.40 141.2,74.5 140.7,75 v140.7,76.4
  Route15 0.254: JP3.1 128.78,120.52 134.6,114.7 134.6,113.8
  Route15 0.305: 134.6,113.8 134.6,82.3 v140.7,76.4
SCL  (via drill 0.3 pad 0.25)
  Top 0.254: J2.38 140.8,72.6 139.7,73.7 v139.7,74.5
  Route15 0.254: JP3.4 129.3,112.9 131.5,110.7 131.5,78.2 135.2,74.5 v139.7,74.5
SDA  (via drill 0.3 pad 0.25)
  Top 0.254: J2.42 141.6,72.9 143.2,74.5 v143.2,76.4
  Route2 0.254: v133.8,78.4 141.2,78.4 v143.2,76.4
  Route15 0.254: JP3.3 129.76,115.44 132.7,112.5 132.7,79.5 v133.8,78.4
TCK/SWCLK  (via drill 0.3)
  Top 0.254: J1.77 148.8,22.2 149.7,21.3 149.7,16.7 v154.1,12.3 | J3.4 34.66,26.84 37,24.5 37,16.3 38.3,15 v38.3,13.6
  Route2 0.254: v38.3,13.6 38.3,8.4 45.3,1.4 150.9,1.4 154.1,4.6 v154.1,12.3
TDO/SWO  (via drill 0.3 pad 0.25)
  Top 0.254: J3.6 34.02,25.57 v35.5,24.1 | v92,14.2 102.1,14.2 109.7,21.8 116.1,21.8 121,26.7 126.1,26.7 v128,24.8 | v150.5,23.5 149.6,23.5 149.2,23.9 J1.79
  Route2 0.254: v152,19.5 152,22 v150.5,23.5
  Route15 0.305: v152,19.5 131.1,19.5 128,22.6 v128,24.8
  Bottom 0.305: v35.5,24.1 47.5,12.1 89.9,12.1 v92,14.2
TMS/SWDIO  (via drill 0.3)
  Top 0.254: J3.2 34.69,28.11 38,24.8 38,16.7 39.7,15 v39.7,13.6 | v148.4,17.9 J1.75
  Route2 0.254: v39.7,13.6 39.7,8.1 45.7,2.1 150.7,2.1 151.4,2.8 151.4,14.9 v148.4,17.9
UART0-RX  (via drill 0.3)
  Top 0.254: v138.8,32.5 138.8,30.7 140,29.5 J1.34
  Route2 0.254: 1.MP 137.3,35.2 138.8,33.7 v138.8,32.5
UART0-TX  (via drill 0.3)
  Top 0.254: v140.7,32.5 140.7,29.8 140.4,29.5 J1.36
  Route2 0.254: 2.MP 136.2,38.9 140.7,34.4 v140.7,32.5
ZENIT_RX_ROT  (via drill 0.7)
  Top 0.61: P2.7 P1.4 v143.3,88.6 | v122.7,9.3 74.8,9.3 73.9,8.4 MOTOR_ZENIT.P$2
  Bottom 0.61: v122.7,9.3 124.2,9.3 131.3,16.4 131.3,82.6 135.6,86.9 143.2,86.9 143.3,87 v143.3,88.6
ZENIT_TX_ROT  (via drill 0.7)
  Top 0.381: 140.34,106.95 P2.10
  Top 0.61: 140.34,106.95 140.34,97.86 P1.1 v140.3,88.6 | v120.1,10.5 74.2,10.5 72.65,8.95 MOTOR_ZENIT.P$1
  Bottom 0.61: v120.1,10.5 123.6,10.5 129.9,16.8 129.9,83.4 135.1,88.6 v140.3,88.6

### Text on the board
Dimension: 330UF | L | J2 | J1 | 100UF | C3
tNames: C1 | 50V_zenit_POWER + | ROTOR-KHAMEX-K1 | SAO | SOX | CS | SCX | SDA | INT1 | SCL | INT2 | GND | OCS | 3V3 | VIN | TL_12-V. | D5 | VIN-5V | MOTOR +50V | MOTOR - | +12V_KH | BAT + | BAT - | GND_KH | GND_POWER - | ROT_POWER + | ROT_POWER - | RESET